# Altium project Aquarium_ATO_V1_0.PrjPcb
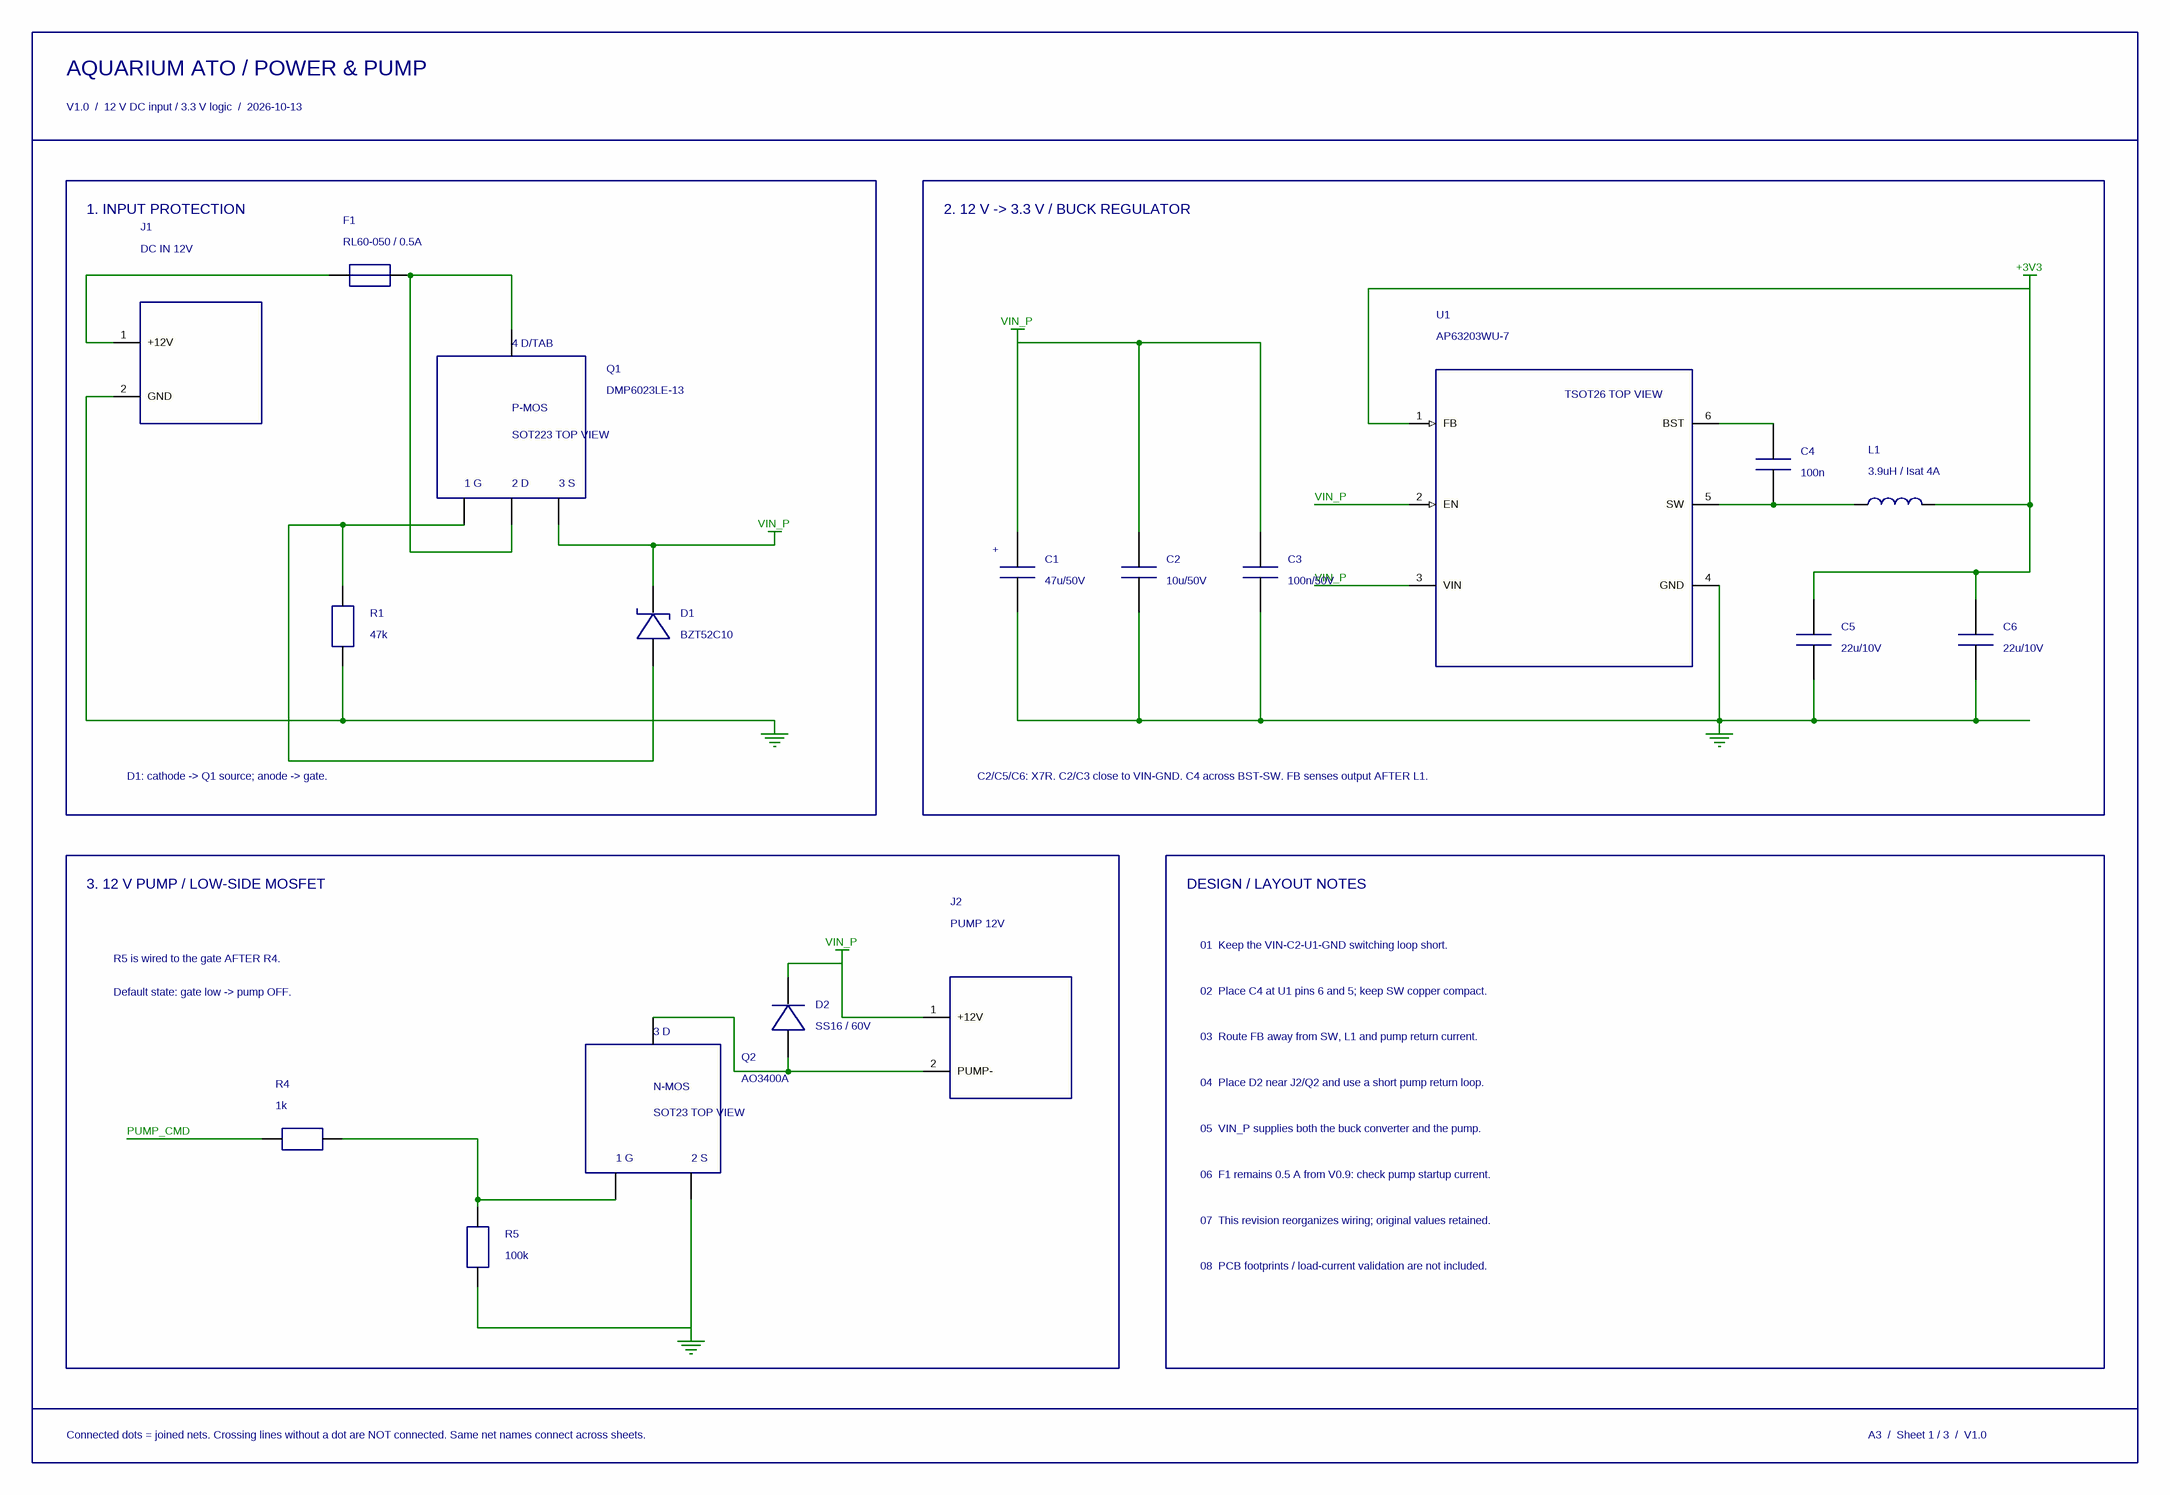
[diagram p0: 01_Power_Pump.SchDoc]
3 sheets, 64 parts. Net scope: global (net labels, ports and power ports of the same name join across sheets).
Board file: Aquarium_ATO_V1_0_LCEDA.PcbDoc
Sheets:
  01_Power_Pump.SchDoc
  02_Controller_IO.SchDoc
  03_Sensors.SchDoc

## Sheet 01_Power_Pump.SchDoc
size 406 x 279 mm

### Parts
C1  47u/50V  [CP_RADIAL_D8.0_P3.50]
C2  10u/50V  [C_1210_3225Metric]
C3  100n/50V  [C_0603_1608Metric]
C4  100n  [C_0603_1608Metric]
C5  22u/10V  [C_0805_2012Metric]
C6  22u/10V  [C_0805_2012Metric]
D1  BZT52C10  [SOD-123]
D2  SS16 / 60V  [D_SMA]
F1  RL60-050 / 0.5A  [PPTC_RADIAL_P5.10_D8.0]
J1  DC IN 12V  [TB_2P_P5.08]
J2  PUMP 12V  [TB_2P_P5.08]
L1  3.9uH / Isat 4A  [IND_SMD_6.0x6.0]
Q1  DMP6023LE-13  [SOT-223-4]
Q2  AO3400A  [SOT-23-3]
R1  47k  [R_0603_1608Metric]
R4  1k  [R_0603_1608Metric]
R5  100k  [R_0603_1608Metric]
U1  AP63203WU-7  [TSOT-23-6_P0.95]

### Blocks framed on the sheet
1. INPUT PROTECTION: D1 F1 J1 Q1 R1
2. 12 V -> 3.3 V / BUCK REGULATOR: C1-C6 L1 U1
3. 12 V PUMP / LOW-SIDE MOSFET: D2 J2 Q2 R4 R5

### Nets
+3V3: C5.1 C6.1 L1.2 U1.1(FB)
GND: C1.2 C2.2 C3.2 C5.2 C6.2 J1.2(GND) Q2.2(S) R1.2 R5.2 U1.4(GND)
VIN_P: C1.1 C2.1 C3.1 D1.1(K) D2.1(K) J2.1(+12V) Q1.3(S) U1.2(EN) U1.3(VIN)
PUMP_CMD: R4.1
NetC4_1: C4.1 U1.6(BST)
NetC4_2: C4.2 L1.1 U1.5(SW)
NetD1_2: D1.2(A) Q1.1(G) R1.1
NetD2_2: D2.2(A) J2.2(PUMP-) Q2.3(D)
NetF1_1: F1.1 J1.1(+12V)
NetF1_2: F1.2 Q1.2(D) Q1.4(D_/_TAB)
NetQ2_1: Q2.1(G) R4.2 R5.1

### Notes on the sheet
- AQUARIUM ATO / POWER & PUMP
- V1.0  /  12 V DC input / 3.3 V logic  /  2026-10-13
- D1: cathode -> Q1 source; anode -> gate.
- C2/C5/C6: X7R. C2/C3 close to VIN-GND. C4 across BST-SW. FB senses output AFTER L1.
- DESIGN / LAYOUT NOTES
- R5 is wired to the gate AFTER R4.
- 01  Keep the VIN-C2-U1-GND switching loop short.
- Default state: gate low -> pump OFF.
- 02  Place C4 at U1 pins 6 and 5; keep SW copper compact.
- 03  Route FB away from SW, L1 and pump return current.
- 04  Place D2 near J2/Q2 and use a short pump return loop.
- 05  VIN_P supplies both the buck converter and the pump.
- 06  F1 remains 0.5 A from V0.9: check pump startup current.
- 07  This revision reorganizes wiring; original values retained.
- 08  PCB footprints / load-current validation are not included.
- Connected dots = joined nets. Crossing lines without a dot are NOT connected. Same net names connect across sheets.
- A3  /  Sheet 1 / 3  /  V1.0
- (in symbol AP63203WU_7) TSOT26 TOP VIEW
- (in symbol CAPACITOR_POLARIZED_RADIAL) +
- (in symbol NMOS_AO3400A) 3 D; N-MOS; SOT23 TOP VIEW; 1 G; 2 S
- (in symbol PMOS_DMP6023LE) 4 D/TAB; P-MOS; SOT223 TOP VIEW; 1 G; 2 D; 3 S

### Library data of the parts
C1 = CAPACITOR_POLARIZED_RADIAL: 47u/50V; footprint CP_RADIAL_D8.0_P3.50
C2 = CAPACITOR_C_1210_3225METRIC: 10u/50V; footprint C_1210_3225Metric
C3 = CAPACITOR_C_0603_1608METRIC: 100n/50V; footprint C_0603_1608Metric
C4 = CAPACITOR_C_0603_1608METRIC: 100n; footprint C_0603_1608Metric
C5 C6 = CAPACITOR_C_0805_2012METRIC: 22u/10V; footprint C_0805_2012Metric
D1 = ZENER_DIODE: BZT52C10; package SOD-123; footprint SOD-123
D2 = DIODE: SS16 / 60V; package SMA; footprint D_SMA
F1 = PTC_RESETTABLE_FUSE: RL60-050 / 0.5A; package Radial leaded PPTC; footprint PPTC_RADIAL_P5.10_D8.0
J1 = DC_INPUT_2P: DC IN 12V; footprint TB_2P_P5.08
J2 = PUMP_OUTPUT_2P: PUMP 12V; footprint TB_2P_P5.08
L1 = INDUCTOR_6X6: 3.9uH / Isat 4A; footprint IND_SMD_6.0x6.0
Q1 = PMOS_DMP6023LE: DMP6023LE-13; package SOT223 (tab/pad 4 = drain); footprint SOT-223-4
Q2 = NMOS_AO3400A: AO3400A; package SOT23; footprint SOT-23-3
R1 = RESISTOR_0603: 47k; footprint R_0603_1608Metric
R4 = RESISTOR_0603: 1k; footprint R_0603_1608Metric
R5 = RESISTOR_0603: 100k; footprint R_0603_1608Metric
U1 = AP63203WU_7: AP63203WU-7; package TSOT26; footprint TSOT-23-6_P0.95

## Sheet 02_Controller_IO.SchDoc
size 406 x 279 mm
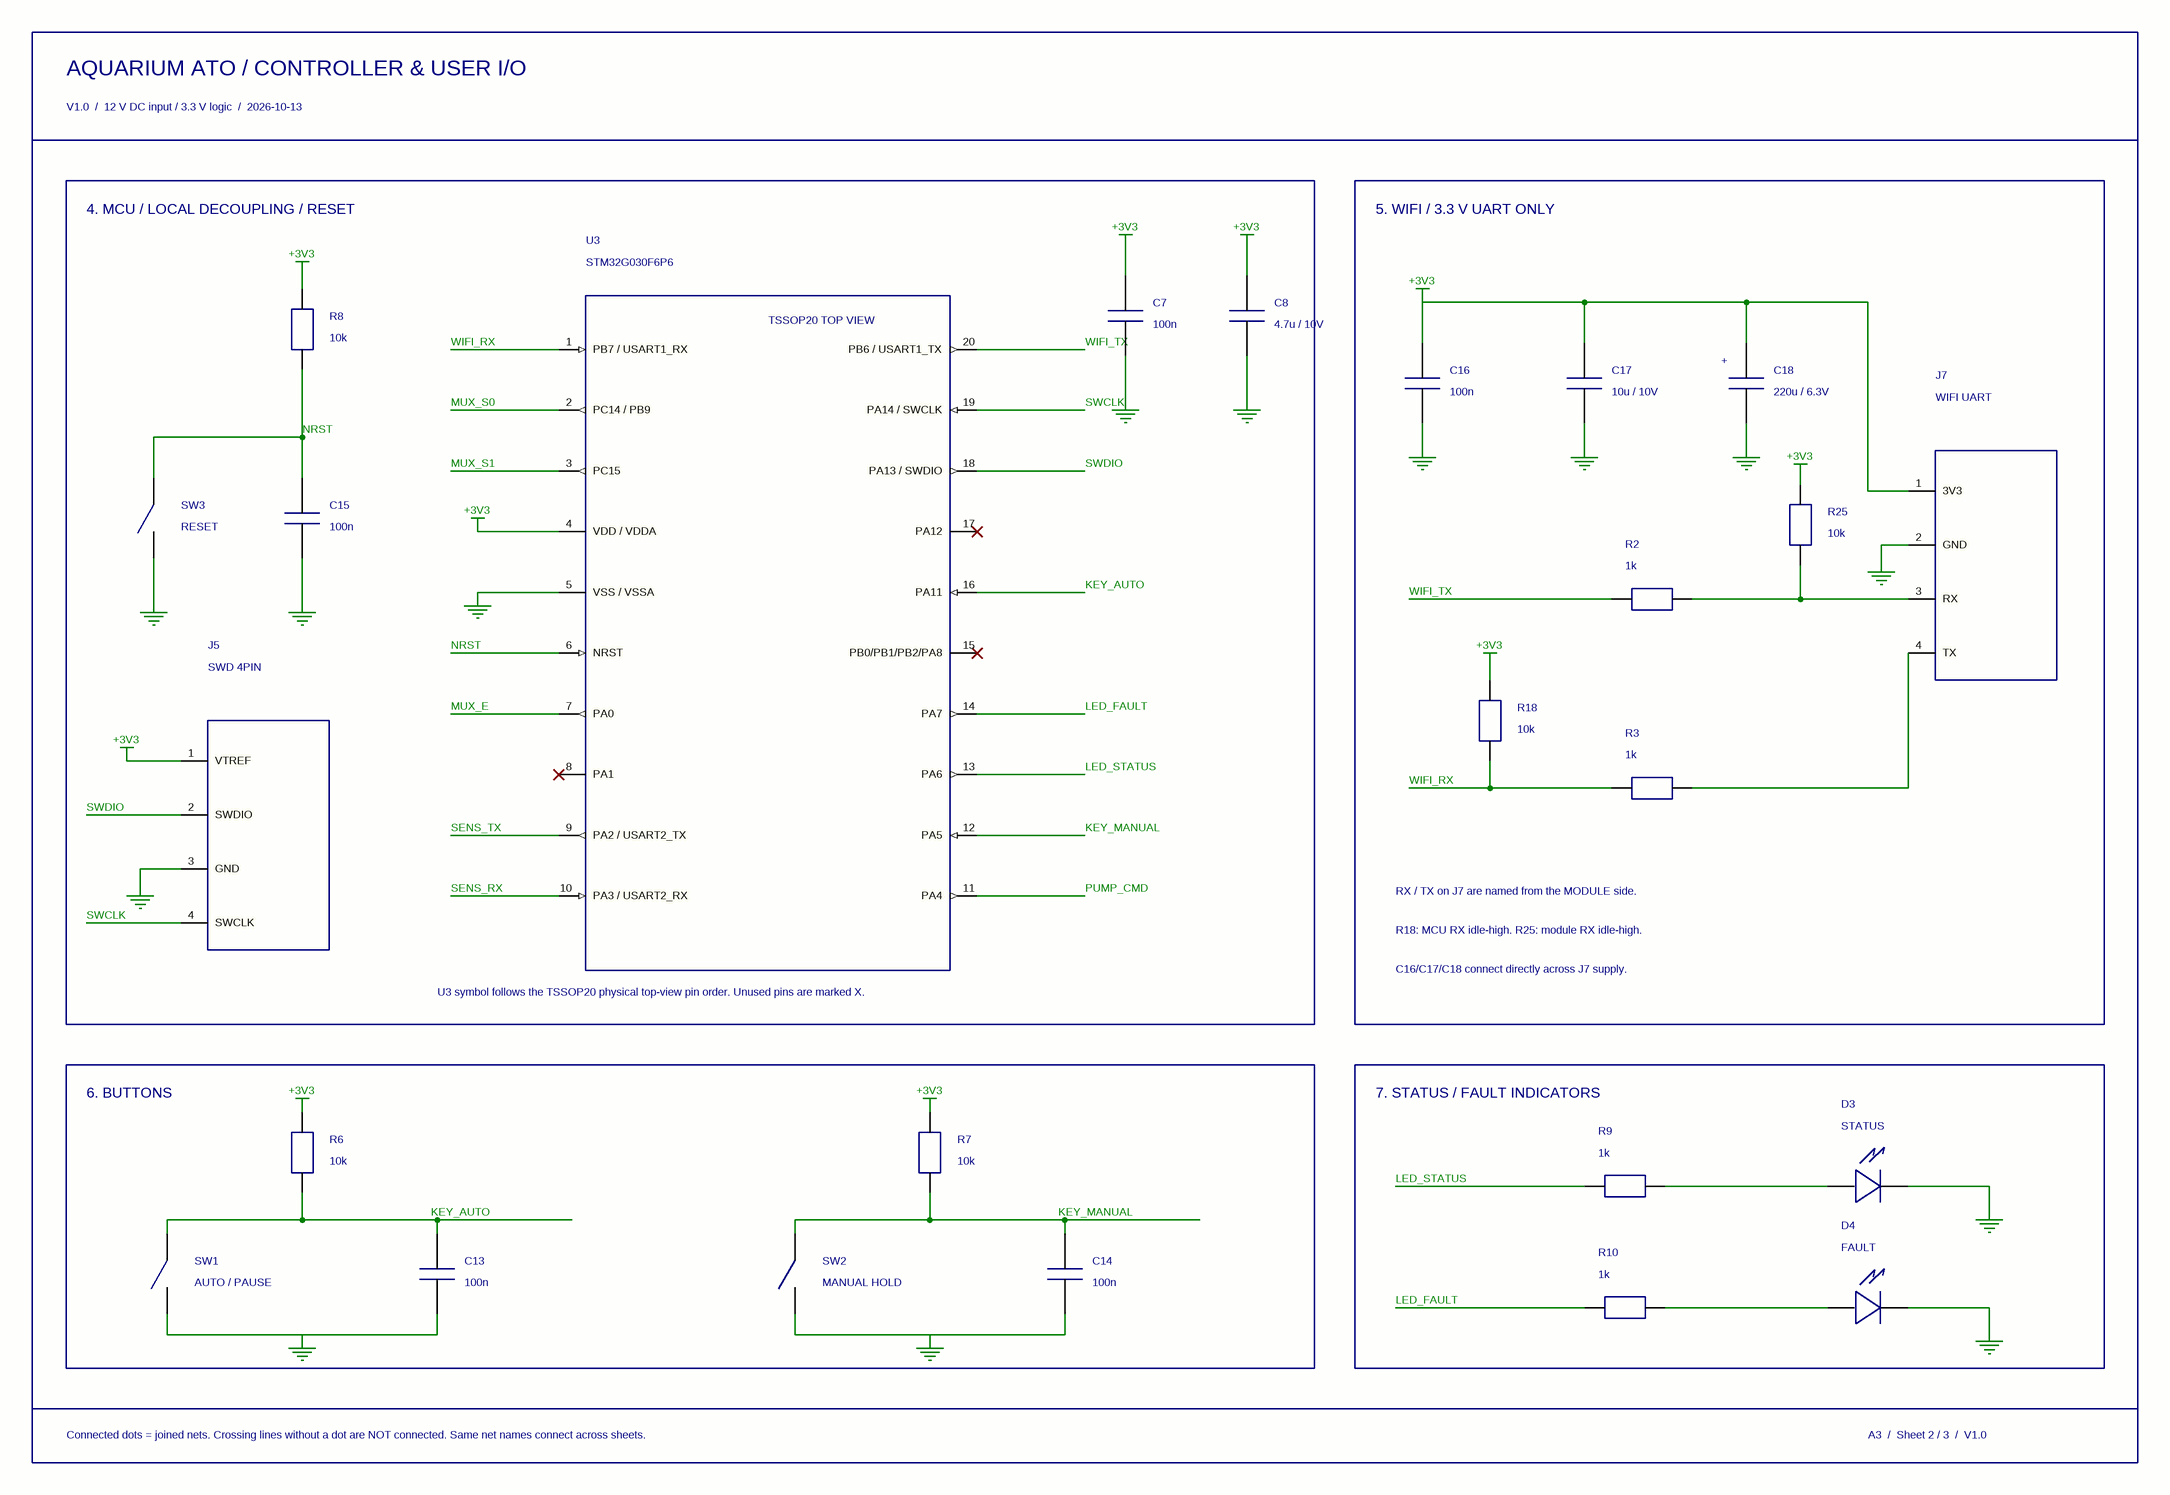
[diagram p1: 02_Controller_IO.SchDoc]

### Parts
C7  100n  [C_0603_1608Metric]
C8  4.7u / 10V  [C_0805_2012Metric]
C13  100n  [C_0603_1608Metric]
C14  100n  [C_0603_1608Metric]
C15  100n  [C_0603_1608Metric]
C16  100n  [C_0603_1608Metric]
C17  10u / 10V  [C_0805_2012Metric]
C18  220u / 6.3V  [CP_RADIAL_D8.0_P3.50]
D3  STATUS  [LED_0603_1608Metric]
D4  FAULT  [LED_0603_1608Metric]
J5  SWD 4PIN  [HDR_1x4_P2.54]
J7  WIFI UART  [HDR_1x4_P2.54]
R2  1k  [R_0603_1608Metric]
R3  1k  [R_0603_1608Metric]
R6  10k  [R_0603_1608Metric]
R7  10k  [R_0603_1608Metric]
R8  10k  [R_0603_1608Metric]
R9  1k  [R_0603_1608Metric]
R10  1k  [R_0603_1608Metric]
R18  10k  [R_0603_1608Metric]
R25  10k  [R_0603_1608Metric]
SW1  AUTO / PAUSE  [SW_TACT_6x6_4P]
SW2  MANUAL HOLD  [SW_TACT_6x6_4P]
SW3  RESET  [SW_TACT_6x6_4P]
U3  STM32G030F6P6  [TSSOP-20_P0.65]

### Blocks framed on the sheet
4. MCU / LOCAL DECOUPLING / RESET: C7 C8 C15 J5 R8 SW3 U3
5. WIFI / 3.3 V UART ONLY: C16-C18 J7 R2 R3 R18 R25
6. BUTTONS: C13 C14 R6 R7 SW1 SW2
7. STATUS / FAULT INDICATORS: D3 D4 R9 R10

### Nets
+3V3: C7.1 C8.1 C16.1 C17.1 C18.1 J5.1(VTREF) J7.1(3V3) R6.1 R7.1 R8.1 R18.1 R25.1 U3.4(VDD_/_VDDA)
GND: C7.2 C8.2 C13.2 C14.2 C15.2 C16.2 C17.2 C18.2 D3.1(K) D4.1(K) J5.3(GND) J7.2(GND) SW1.2 SW2.2 SW3.2 U3.5(VSS_/_VSSA)
KEY_AUTO: C13.1 R6.2 SW1.1 U3.16(PA11)
KEY_MANUAL: C14.1 R7.2 SW2.1 U3.12(PA5)
LED_FAULT: R10.1 U3.14(PA7)
LED_STATUS: R9.1 U3.13(PA6)
MUX_E: U3.7(PA0)
MUX_S0: U3.2(PC14_/_PB9)
MUX_S1: U3.3(PC15)
NRST: C15.1 R8.2 SW3.1 U3.6(NRST)
PUMP_CMD: U3.11(PA4)
SENS_RX: U3.10(PA3_/_USART2_RX)
SENS_TX: U3.9(PA2_/_USART2_TX)
SWCLK: J5.4(SWCLK) U3.19(PA14_/_SWCLK)
SWDIO: J5.2(SWDIO) U3.18(PA13_/_SWDIO)
WIFI_RX: R3.1 R18.2 U3.1(PB7_/_USART1_RX)
WIFI_TX: R2.1 U3.20(PB6_/_USART1_TX)
NetD3_2: D3.2(A) R9.2
NetD4_2: D4.2(A) R10.2
NetJ7_3: J7.3(RX) R2.2 R25.2
NetJ7_4: J7.4(TX) R3.2

Not connected (* = marked no-connect by the designer): U3 8(PA1)* 15(PB0/PB1/PB2/PA8)* 17(PA12)*

### Notes on the sheet
- AQUARIUM ATO / CONTROLLER & USER I/O
- V1.0  /  12 V DC input / 3.3 V logic  /  2026-10-13
- RX / TX on J7 are named from the MODULE side.
- R18: MCU RX idle-high. R25: module RX idle-high.
- C16/C17/C18 connect directly across J7 supply.
- U3 symbol follows the TSSOP20 physical top-view pin order. Unused pins are marked X.
- Connected dots = joined nets. Crossing lines without a dot are NOT connected. Same net names connect across sheets.
- A3  /  Sheet 2 / 3  /  V1.0
- (in symbol CAPACITOR_POLARIZED_RADIAL) +
- (in symbol STM32G030F6P6) TSSOP20 TOP VIEW

### Library data of the parts
C7 C13-C16 = CAPACITOR_C_0603_1608METRIC: 100n; footprint C_0603_1608Metric
C8 = CAPACITOR_C_0805_2012METRIC: 4.7u / 10V; footprint C_0805_2012Metric
C17 = CAPACITOR_C_0805_2012METRIC: 10u / 10V; footprint C_0805_2012Metric
C18 = CAPACITOR_POLARIZED_RADIAL: 220u / 6.3V; footprint CP_RADIAL_D8.0_P3.50
D3 = LED_0603: STATUS; footprint LED_0603_1608Metric
D4 = LED_0603: FAULT; footprint LED_0603_1608Metric
J5 = SWD_4P: SWD 4PIN; footprint HDR_1x4_P2.54
J7 = WIFI_UART_4P: WIFI UART; footprint HDR_1x4_P2.54
R2 R3 R9 R10 = RESISTOR_0603: 1k; footprint R_0603_1608Metric
R6-R8 R18 R25 = RESISTOR_0603: 10k; footprint R_0603_1608Metric
SW1 = SWITCH_TACT_6X6: AUTO / PAUSE; footprint SW_TACT_6x6_4P
SW2 = SWITCH_TACT_6X6: MANUAL HOLD; footprint SW_TACT_6x6_4P
SW3 = SWITCH_TACT_6X6: RESET; footprint SW_TACT_6x6_4P
U3 = STM32G030F6P6: STM32G030F6P6; package TSSOP20; footprint TSSOP-20_P0.65

## Sheet 03_Sensors.SchDoc
size 406 x 279 mm
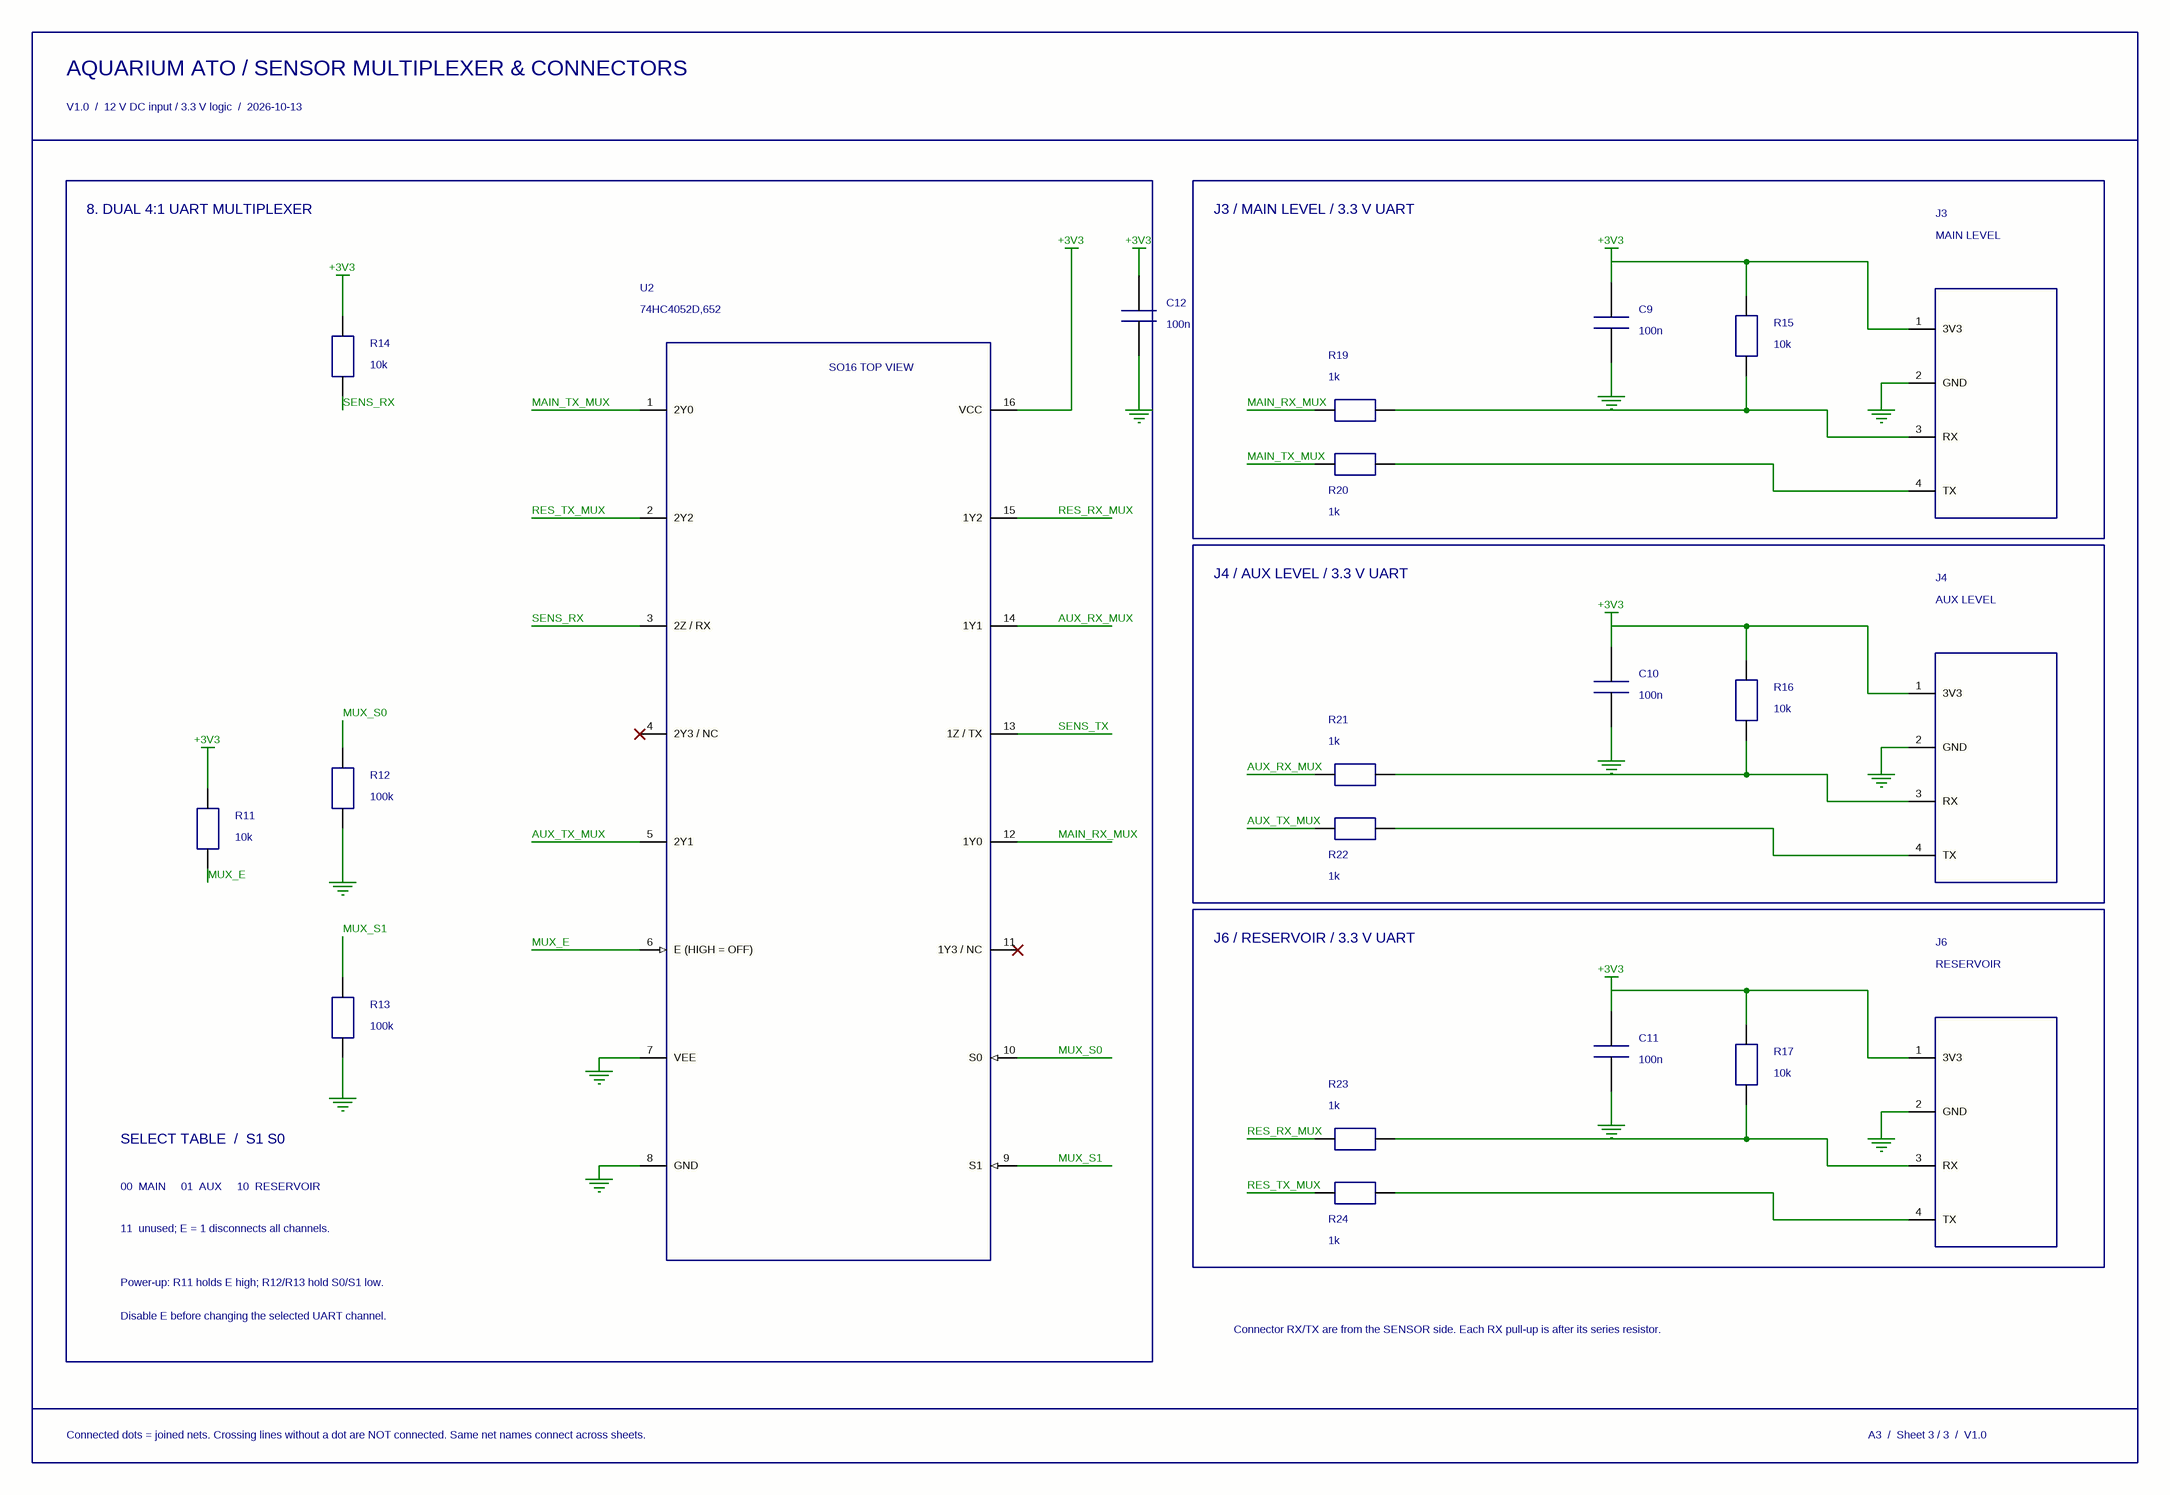
[diagram p2: 03_Sensors.SchDoc]

### Parts
C9  100n  [C_0603_1608Metric]
C10  100n  [C_0603_1608Metric]
C11  100n  [C_0603_1608Metric]
C12  100n  [C_0603_1608Metric]
J3  MAIN LEVEL  [HDR_1x4_P2.54]
J4  AUX LEVEL  [HDR_1x4_P2.54]
J6  RESERVOIR  [HDR_1x4_P2.54]
R11  10k  [R_0603_1608Metric]
R12  100k  [R_0603_1608Metric]
R13  100k  [R_0603_1608Metric]
R14  10k  [R_0603_1608Metric]
R15  10k  [R_0603_1608Metric]
R16  10k  [R_0603_1608Metric]
R17  10k  [R_0603_1608Metric]
R19  1k  [R_0603_1608Metric]
R20  1k  [R_0603_1608Metric]
R21  1k  [R_0603_1608Metric]
R22  1k  [R_0603_1608Metric]
R23  1k  [R_0603_1608Metric]
R24  1k  [R_0603_1608Metric]
U2  74HC4052D,652  [SOIC-16_P1.27]

### Blocks framed on the sheet
J3 / MAIN LEVEL / 3.3 V UART: C9 J3 R15 R19 R20
J4 / AUX LEVEL / 3.3 V UART: C10 J4 R16 R21 R22
J6 / RESERVOIR / 3.3 V UART: C11 J6 R17 R23 R24

### Nets
+3V3: C9.1 C10.1 C11.1 C12.1 J3.1(3V3) J4.1(3V3) J6.1(3V3) R11.1 R14.1 R15.1 R16.1 R17.1 U2.16(VCC)
GND: C9.2 C10.2 C11.2 C12.2 J3.2(GND) J4.2(GND) J6.2(GND) R12.2 R13.2 U2.7(VEE) U2.8(GND)
AUX_RX_MUX: R21.1 U2.14(1Y1)
AUX_TX_MUX: R22.1 U2.5(2Y1)
MAIN_RX_MUX: R19.1 U2.12(1Y0)
MAIN_TX_MUX: R20.1 U2.1(2Y0)
MUX_E: R11.2 U2.6(E_(HIGH_=_OFF))
MUX_S0: R12.1 U2.10(S0)
MUX_S1: R13.1 U2.9(S1)
RES_RX_MUX: R23.1 U2.15(1Y2)
RES_TX_MUX: R24.1 U2.2(2Y2)
SENS_RX: R14.2 U2.3(2Z_/_RX)
SENS_TX: U2.13(1Z_/_TX)
NetJ3_3: J3.3(RX) R15.2 R19.2
NetJ3_4: J3.4(TX) R20.2
NetJ4_3: J4.3(RX) R16.2 R21.2
NetJ4_4: J4.4(TX) R22.2
NetJ6_3: J6.3(RX) R17.2 R23.2
NetJ6_4: J6.4(TX) R24.2

Not connected (* = marked no-connect by the designer): U2 4(2Y3_/_NC)* 11(1Y3_/_NC)*

### Notes on the sheet
- AQUARIUM ATO / SENSOR MULTIPLEXER & CONNECTORS
- V1.0  /  12 V DC input / 3.3 V logic  /  2026-10-13
- 8. DUAL 4:1 UART MULTIPLEXER
- SELECT TABLE  /  S1 S0
- 00  MAIN     01  AUX     10  RESERVOIR
- 11  unused; E = 1 disconnects all channels.
- Power-up: R11 holds E high; R12/R13 hold S0/S1 low.
- Disable E before changing the selected UART channel.
- Connector RX/TX are from the SENSOR side. Each RX pull-up is after its series resistor.
- Connected dots = joined nets. Crossing lines without a dot are NOT connected. Same net names connect across sheets.
- A3  /  Sheet 3 / 3  /  V1.0
- (in symbol 74HC4052D) SO16 TOP VIEW

### Library data of the parts
C9-C12 = CAPACITOR_C_0603_1608METRIC: 100n; footprint C_0603_1608Metric
J3 = SENSOR_UART_4P: MAIN LEVEL; footprint HDR_1x4_P2.54
J4 = SENSOR_UART_4P: AUX LEVEL; footprint HDR_1x4_P2.54
J6 = SENSOR_UART_4P: RESERVOIR; footprint HDR_1x4_P2.54
R11 R14-R17 = RESISTOR_0603: 10k; footprint R_0603_1608Metric
R12 R13 = RESISTOR_0603: 100k; footprint R_0603_1608Metric
R19-R24 = RESISTOR_0603: 1k; footprint R_0603_1608Metric
U2 = 74HC4052D: 74HC4052D,652; package SO16 (SOT109-1); footprint SOIC-16_P1.27

## Nets that join several sheets
+3V3: 01_Power_Pump (C5.1 C6.1 L1.2 U1.1), 02_Controller_IO (13 pins), 03_Sensors (13 pins)
GND: 01_Power_Pump (10 pins), 02_Controller_IO (16 pins), 03_Sensors (11 pins)
MUX_E: 02_Controller_IO (U3.7), 03_Sensors (R11.2 U2.6)
MUX_S0: 02_Controller_IO (U3.2), 03_Sensors (R12.1 U2.10)
MUX_S1: 02_Controller_IO (U3.3), 03_Sensors (R13.1 U2.9)
PUMP_CMD: 01_Power_Pump (R4.1), 02_Controller_IO (U3.11)
SENS_RX: 02_Controller_IO (U3.10), 03_Sensors (R14.2 U2.3)
SENS_TX: 02_Controller_IO (U3.9), 03_Sensors (U2.13)